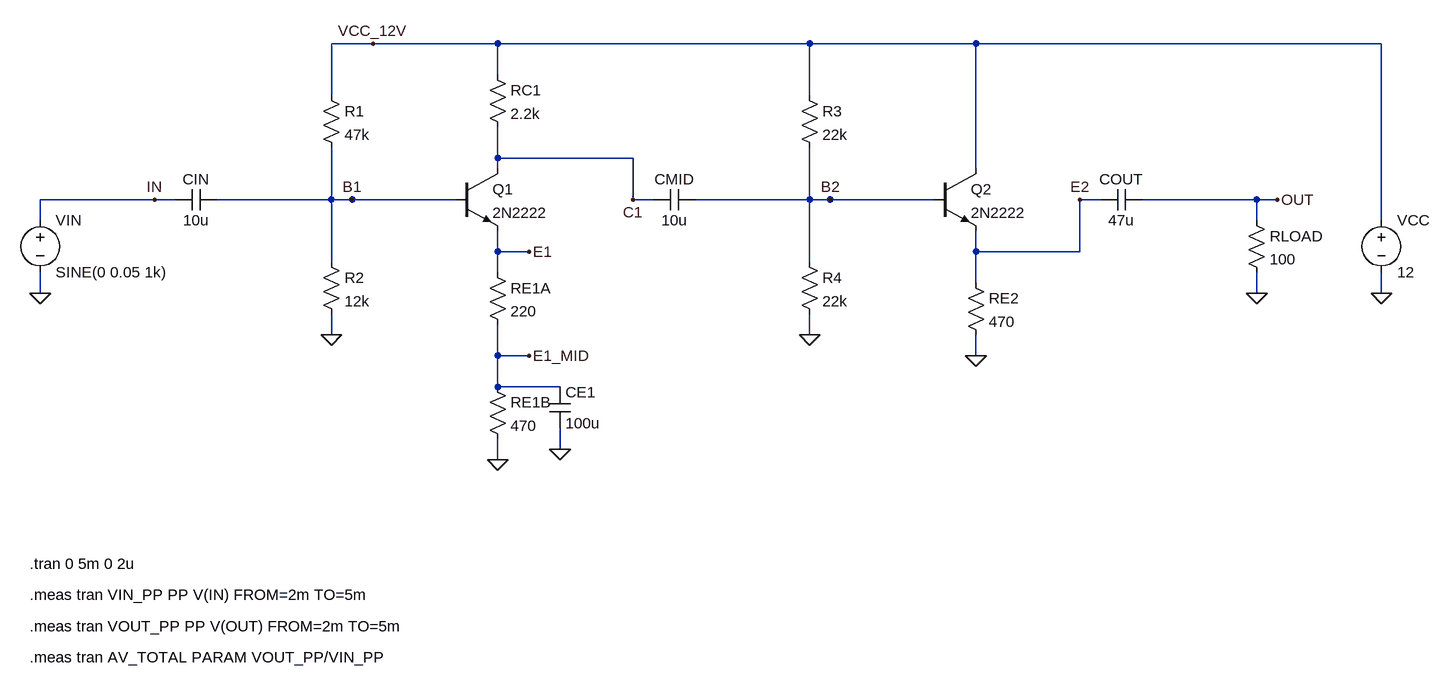
[diagram p0: schematic estilo_B_power_rail_bus.asc]
estilo_B_power_rail_bus.asc, the LTspice schematic file:
Version 4
SHEET 1 2880 1136
WIRE 80 320 80 288
WIRE 80 288 112 288
WIRE 80 400 80 432
WIRE 288 288 256 288
WIRE 352 288 384 288
WIRE 528 128 528 48
WIRE 528 208 528 384
WIRE 528 288 560 288
WIRE 528 464 528 496
WIRE 720 288 688 288
WIRE 784 96 784 48
WIRE 784 176 784 240
WIRE 784 224 832 224
WIRE 784 336 784 400
WIRE 784 368 832 368
WIRE 784 480 784 576
WIRE 784 528 832 528
WIRE 784 656 784 688
WIRE 784 576 880 576
WIRE 880 640 880 672
WIRE 1024 288 992 288
WIRE 1088 288 1120 288
WIRE 1264 128 1264 48
WIRE 1264 208 1264 384
WIRE 1264 288 1296 288
WIRE 1264 464 1264 496
WIRE 1456 288 1424 288
WIRE 1520 240 1520 48
WIRE 1520 336 1520 416
WIRE 1520 368 1568 368
WIRE 1520 496 1520 528
WIRE 1712 288 1680 288
WIRE 1776 288 1808 288
WIRE 1952 320 1952 288
WIRE 1952 288 1984 288
WIRE 1952 400 1952 432
WIRE 2144 320 2144 48
WIRE 2144 400 2144 432
WIRE 528 48 2144 48
WIRE 112 288 256 288
WIRE 1808 288 1984 288
WIRE 1568 368 1680 368
WIRE 1680 368 1680 288
WIRE 832 224 992 224
WIRE 992 224 992 288
WIRE 384 288 560 288
WIRE 560 288 688 288
WIRE 1120 288 1296 288
WIRE 1296 288 1424 288
FLAG 80 432 0
FLAG 256 288 IN
FLAG 560 288 B1
FLAG 528 496 0
FLAG 832 368 E1
FLAG 832 528 E1_MID
FLAG 784 688 0
FLAG 880 672 0
FLAG 992 288 C1
FLAG 1296 288 B2
FLAG 1264 496 0
FLAG 1520 528 0
FLAG 1680 288 E2
FLAG 1984 288 OUT
FLAG 1952 432 0
FLAG 2144 432 0
FLAG 592 48 VCC_12V
SYMBOL voltage 80 304 R0
WINDOW 3 24 96 Left 2
SYMATTR InstName VIN
SYMATTR Value SINE(0 0.05 1k)
SYMBOL cap 352 272 R90
WINDOW 0 0 32 VBottom 2
WINDOW 3 32 32 VTop 2
SYMATTR InstName CIN
SYMATTR Value 10u
SYMBOL res 512 112 R0
SYMATTR InstName R1
SYMATTR Value 47k
SYMBOL res 512 368 R0
SYMATTR InstName R2
SYMATTR Value 12k
SYMBOL npn 720 240 R0
SYMATTR InstName Q1
SYMATTR Value 2N2222
SYMBOL res 768 80 R0
SYMATTR InstName RC1
SYMATTR Value 2.2k
SYMBOL res 768 384 R0
SYMATTR InstName RE1A
SYMATTR Value 220
SYMBOL res 768 560 R0
SYMATTR InstName RE1B
SYMATTR Value 470
SYMBOL cap 864 576 R0
SYMATTR InstName CE1
SYMATTR Value 100u
SYMBOL cap 1088 272 R90
WINDOW 0 0 32 VBottom 2
WINDOW 3 32 32 VTop 2
SYMATTR InstName CMID
SYMATTR Value 10u
SYMBOL res 1248 112 R0
SYMATTR InstName R3
SYMATTR Value 22k
SYMBOL res 1248 368 R0
SYMATTR InstName R4
SYMATTR Value 22k
SYMBOL npn 1456 240 R0
SYMATTR InstName Q2
SYMATTR Value 2N2222
SYMBOL res 1504 400 R0
SYMATTR InstName RE2
SYMATTR Value 470
SYMBOL cap 1776 272 R90
WINDOW 0 0 32 VBottom 2
WINDOW 3 32 32 VTop 2
SYMATTR InstName COUT
SYMATTR Value 47u
SYMBOL res 1936 304 R0
SYMATTR InstName RLOAD
SYMATTR Value 100
SYMBOL voltage 2144 304 R0
WINDOW 3 24 96 Left 2
SYMATTR InstName VCC
SYMATTR Value 12
TEXT 64 848 Left 2 !.tran 0 5m 0 2u
TEXT 64 896 Left 2 !.meas tran VIN_PP PP V(IN) FROM=2m TO=5m
TEXT 64 944 Left 2 !.meas tran VOUT_PP PP V(OUT) FROM=2m TO=5m
TEXT 64 992 Left 2 !.meas tran AV_TOTAL PARAM VOUT_PP/VIN_PP

The netlist it stands for:
* estilo_B_power_rail_bus.asc
VIN IN 0 SINE(0 0.05 1k)
CIN B1 IN 10u
R1 VCC_12V B1 47k
R2 B1 0 12k
Q1 C1 B1 E1 0 2N2222
RC1 VCC_12V C1 2.2k
RE1A E1 E1_MID 220
RE1B E1_MID 0 470
CE1 E1_MID 0 100u
CMID B2 C1 10u
R3 VCC_12V B2 22k
R4 B2 0 22k
Q2 VCC_12V B2 E2 0 2N2222
RE2 E2 0 470
COUT OUT E2 47u
RLOAD OUT 0 100
VCC VCC_12V 0 12
.model NPN NPN
.model PNP PNP
.lib standard.bjt
.tran 0 5m 0 2u
.meas tran VIN_PP PP V(IN) FROM=2m TO=5m
.meas tran VOUT_PP PP V(OUT) FROM=2m TO=5m
.meas tran AV_TOTAL PARAM VOUT_PP/VIN_PP
.backanno
.end